# Altium schematic sheet Top-Sheet.SchDoc
size 420 x 297 mm; DocumentNumber: 1; SheetNumber: 1
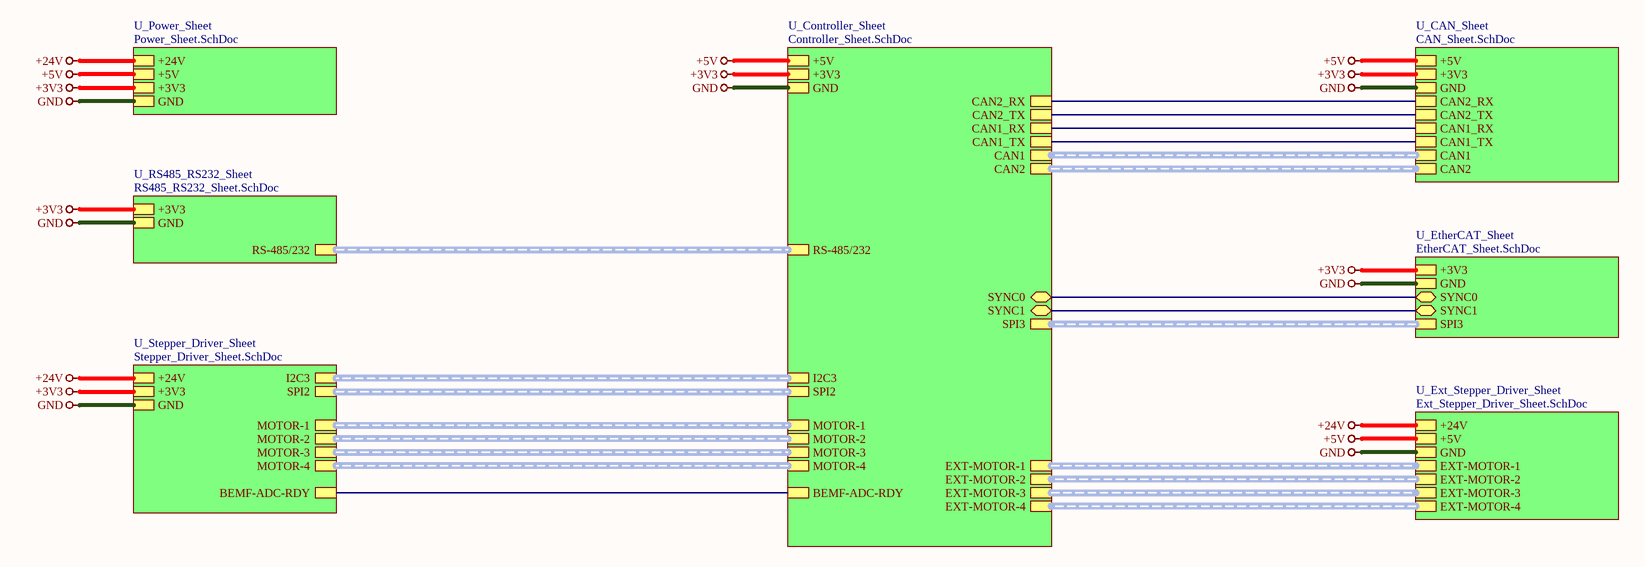
[diagram p0: Top-Sheet.SchDoc]

## Sub-sheets
U_CAN_Sheet = CAN_Sheet.SchDoc: CAN1 (harness CAN1), CAN2_RX, CAN2_TX, +5V, +3V3, GND, CAN1_RX, CAN1_TX, CAN2 (harness CAN2)
U_Controller_Sheet = Controller_Sheet.SchDoc: RS-485/232 (harness RS-485/232), CAN1 (harness CAN1), +3V3, GND, CAN2 (harness CAN2), SPI3 (harness SPI3), SPI2 (harness SPI2), I2C3 (harness I2C3), MOTOR-1 (harness MOTOR-1), MOTOR-2 (harness MOTOR-2), MOTOR-3 (harness MOTOR-3), MOTOR-4 (harness MOTOR-4), +5V, SYNC0 (bidir), SYNC1 (bidir), BEMF-ADC-RDY, EXT-MOTOR-1 (harness EXT-MOTOR-1), EXT-MOTOR-2 (harness EXT-MOTOR-2), EXT-MOTOR-3 (harness EXT-MOTOR-3), EXT-MOTOR-4 (harness EXT-MOTOR-4), CAN2_RX, CAN2_TX, CAN1_RX, CAN1_TX
U_EtherCAT_Sheet = EtherCAT_Sheet.SchDoc: +3V3, GND, SYNC0 (bidir), SYNC1 (bidir), SPI3 (harness SPI3)
U_Ext_Stepper_Driver_Sheet = Ext_Stepper_Driver_Sheet.SchDoc: +5V, GND, EXT-MOTOR-1 (harness EXT-MOTOR-1), EXT-MOTOR-2 (harness EXT-MOTOR-2), EXT-MOTOR-3 (harness EXT-MOTOR-3), EXT-MOTOR-4 (harness EXT-MOTOR-4), +24V
U_Power_Sheet = Power_Sheet.SchDoc: +24V, +5V, +3V3, GND
U_RS485_RS232_Sheet = RS485_RS232_Sheet.SchDoc: RS-485/232 (harness RS-485/232), +3V3, GND
U_Stepper_Driver_Sheet = Stepper_Driver_Sheet.SchDoc: +24V, +3V3, GND, I2C3 (harness I2C3), SPI2 (harness SPI2), MOTOR-1 (harness MOTOR-1), MOTOR-2 (harness MOTOR-2), MOTOR-3 (harness MOTOR-3), MOTOR-4 (harness MOTOR-4), BEMF-ADC-RDY

## Nets
+3V3: sheet U_Power_Sheet/+3V3, sheet U_Controller_Sheet/+3V3, sheet U_CAN_Sheet/+3V3, sheet U_RS485_RS232_Sheet/+3V3, sheet U_EtherCAT_Sheet/+3V3, sheet U_Stepper_Driver_Sheet/+3V3
+5V: sheet U_Power_Sheet/+5V, sheet U_Controller_Sheet/+5V, sheet U_CAN_Sheet/+5V, sheet U_Ext_Stepper_Driver_Sheet/+5V
+24V: sheet U_Power_Sheet/+24V, sheet U_Stepper_Driver_Sheet/+24V, sheet U_Ext_Stepper_Driver_Sheet/+24V
GND: sheet U_Power_Sheet/GND, sheet U_Controller_Sheet/GND, sheet U_CAN_Sheet/GND, sheet U_RS485_RS232_Sheet/GND, sheet U_EtherCAT_Sheet/GND, sheet U_Stepper_Driver_Sheet/GND, sheet U_Ext_Stepper_Driver_Sheet/GND
(unnamed): sheet U_Controller_Sheet/SYNC0, sheet U_EtherCAT_Sheet/SYNC0
(unnamed): sheet U_Controller_Sheet/SYNC1, sheet U_EtherCAT_Sheet/SYNC1
(unnamed): sheet U_Controller_Sheet/BEMF-ADC-RDY, sheet U_Stepper_Driver_Sheet/BEMF-ADC-RDY
(unnamed): sheet U_Controller_Sheet/CAN2_RX, sheet U_CAN_Sheet/CAN2_RX
(unnamed): sheet U_Controller_Sheet/CAN2_TX, sheet U_CAN_Sheet/CAN2_TX
(unnamed): sheet U_Controller_Sheet/CAN1_RX, sheet U_CAN_Sheet/CAN1_RX
(unnamed): sheet U_Controller_Sheet/CAN1_TX, sheet U_CAN_Sheet/CAN1_TX

## Buses and harness runs
harness sheet U_CAN_Sheet/CAN1 = sheet U_Controller_Sheet/CAN1
harness sheet U_CAN_Sheet/CAN2 = sheet U_Controller_Sheet/CAN2
harness sheet U_Controller_Sheet/EXT-MOTOR-1 = sheet U_Ext_Stepper_Driver_Sheet/EXT-MOTOR-1
harness sheet U_Controller_Sheet/EXT-MOTOR-2 = sheet U_Ext_Stepper_Driver_Sheet/EXT-MOTOR-2
harness sheet U_Controller_Sheet/EXT-MOTOR-3 = sheet U_Ext_Stepper_Driver_Sheet/EXT-MOTOR-3
harness sheet U_Controller_Sheet/EXT-MOTOR-4 = sheet U_Ext_Stepper_Driver_Sheet/EXT-MOTOR-4
harness sheet U_Controller_Sheet/I2C3 = sheet U_Stepper_Driver_Sheet/I2C3
harness sheet U_Controller_Sheet/MOTOR-1 = sheet U_Stepper_Driver_Sheet/MOTOR-1
harness sheet U_Controller_Sheet/MOTOR-2 = sheet U_Stepper_Driver_Sheet/MOTOR-2
harness sheet U_Controller_Sheet/MOTOR-3 = sheet U_Stepper_Driver_Sheet/MOTOR-3
harness sheet U_Controller_Sheet/MOTOR-4 = sheet U_Stepper_Driver_Sheet/MOTOR-4
harness sheet U_Controller_Sheet/RS-485/232 = sheet U_RS485_RS232_Sheet/RS-485/232
harness sheet U_Controller_Sheet/SPI2 = sheet U_Stepper_Driver_Sheet/SPI2
harness sheet U_Controller_Sheet/SPI3 = sheet U_EtherCAT_Sheet/SPI3

## Notes on the sheet
- File:
- Title:
- Date:
- Page
- Num:
- Total:
- Drawn By: Huzaifa Ali